# Altium schematic sheet a0206-2006.14.SchDoc
size 558 x 431 mm
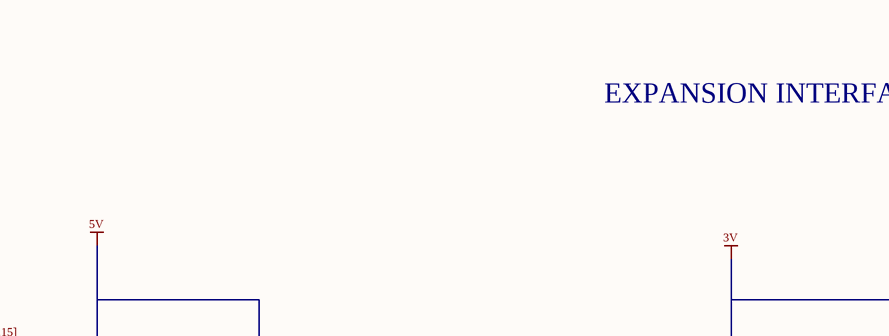
[diagram p0: a0206-2006.14.SchDoc, top left]
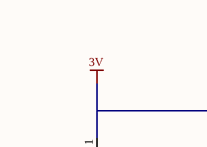
[diagram p1: a0206-2006.14.SchDoc, top right]
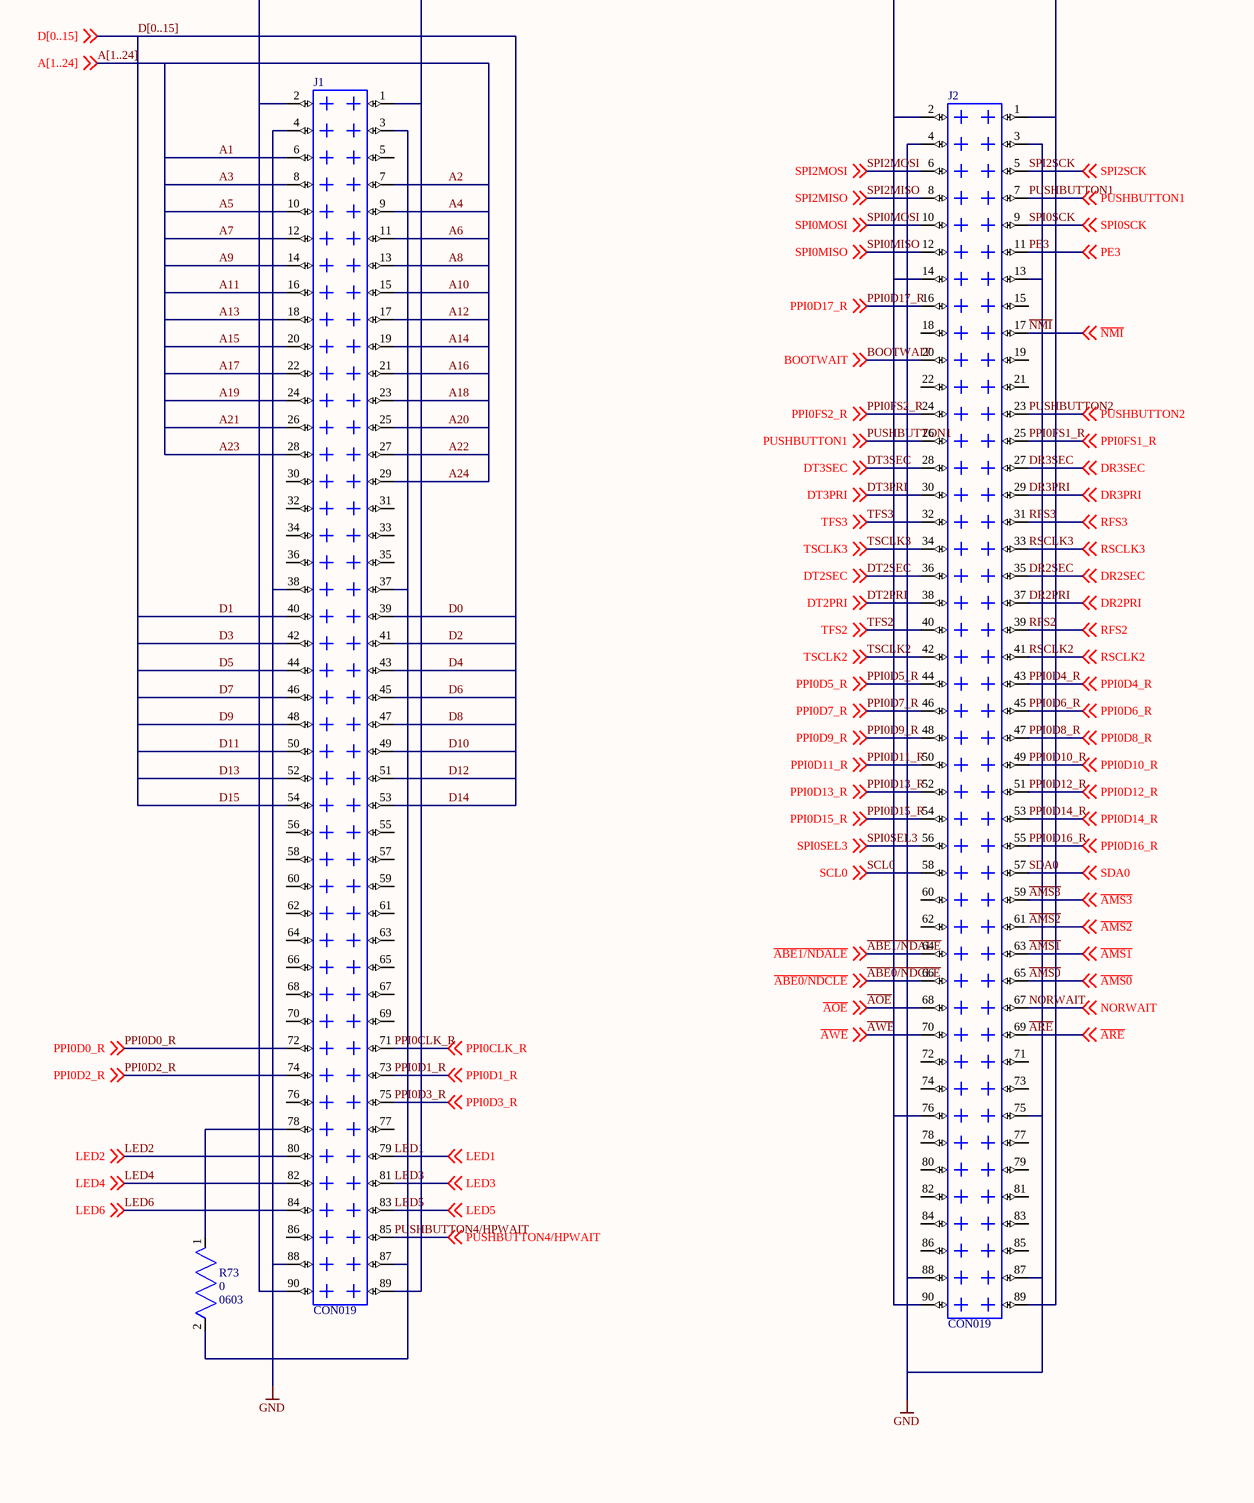
[diagram p2: a0206-2006.14.SchDoc, bottom left]
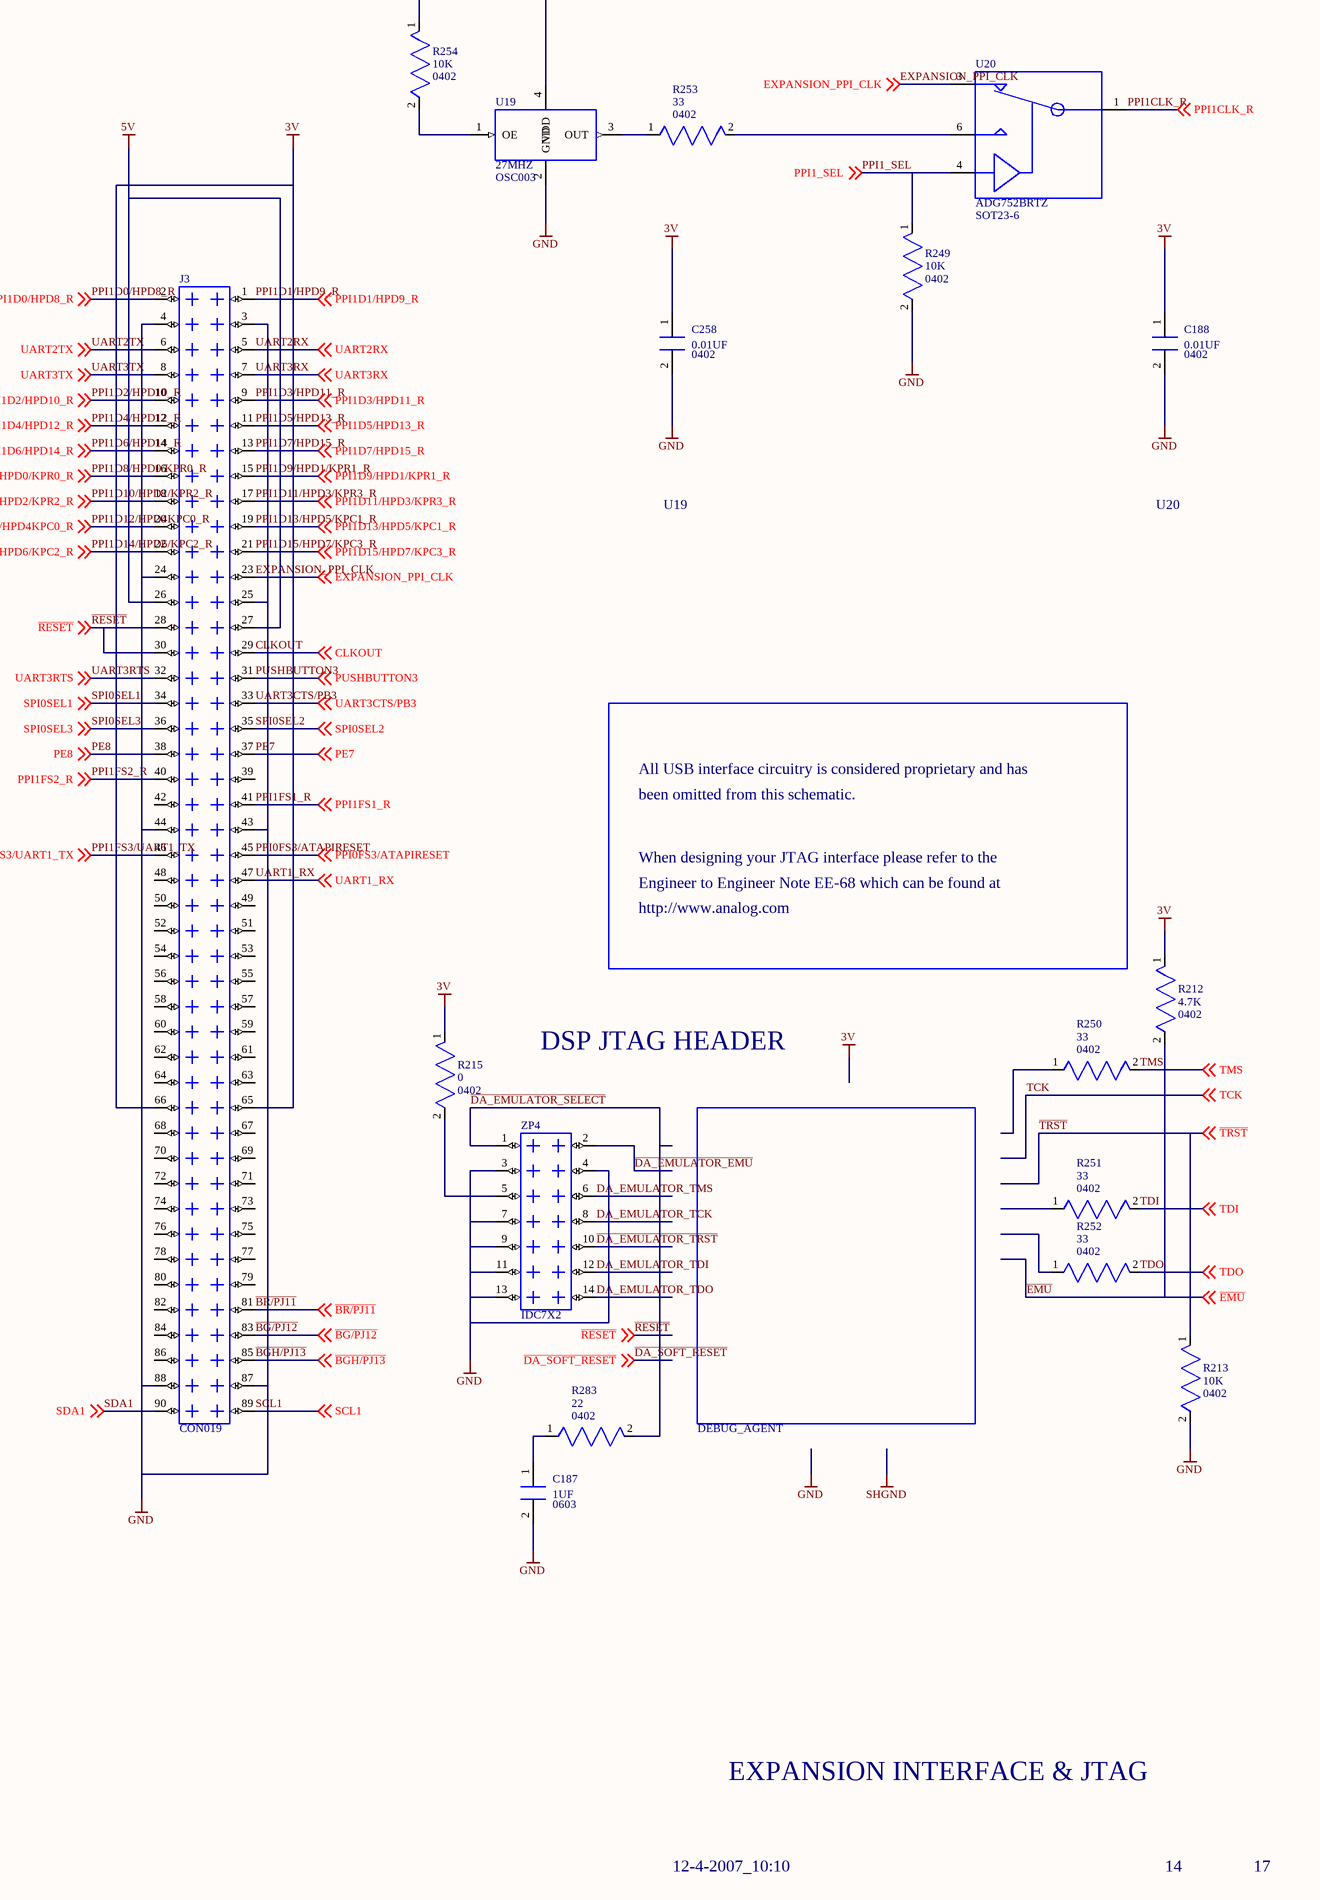
[diagram p3: a0206-2006.14.SchDoc, bottom right]

## Parts
*  DEBUG_AGENT  [DEBUG_AGENT]
C187  value 1UF  [0603]  (hidden comment: *)
C188  value 0.01UF  [0402]  (hidden comment: *)
C258  value 0.01UF  [0402]  (hidden comment: *)
J1  *  [CON019]  (value not drawn)
J2  *  [CON019]  (value not drawn)
J3  *  [CON019]  (value not drawn)
R73  value 0  [0603]  (hidden comment: *)
R212  value 4.7K  [0402]  (hidden comment: *)
R213  value 10K  [0402]  (hidden comment: *)
R215  value 0  [0402]  (hidden comment: *)
R249  value 10K  [0402]  (hidden comment: *)
R250  value 33  [0402]  (hidden comment: *)
R251  value 33  [0402]  (hidden comment: *)
R252  value 33  [0402]  (hidden comment: *)
R253  value 33  [0402]  (hidden comment: *)
R254  value 10K  [0402]  (hidden comment: *)
R283  value 22  [0402]  (hidden comment: *)
U19  value 27MHZ  [OSC003]  (hidden comment: *)
U20  PART: ADG752BRTZ  [SOT23-6]  (hidden comment: *)
ZP4  *  [IDC7X2]  (value not drawn)

## Nets
3V: C188.1(A) C258.1(A) J2.1 J2.2 J2.14 J2.76 J2.89 J2.90 J3.65 J3.66 R212.1(N1) R215.1(N1) R254.1(N1) U19.4(VDD) U20.2(3V)
5V: J1.1 J1.2 J1.89 J1.90 J3.26 J3.27
GND: C187.2(B) C188.2(B) C258.2(B) J1.3 J1.4 J1.37 J1.38 J1.87 J1.88 J2.3 J2.4 J2.13 J2.75 J2.87 J2.88 J3.3 J3.4 J3.24 J3.25 J3.43 J3.44 J3.87 J3.88 R73.2(N2) R213.2(N2) R249.2(N2) U19.2(GND) U20.5(GND) ZP4.3 ZP4.4 ZP4.7 ZP4.9 ZP4.11 ZP4.13
A1: J1.6
A2: J1.7
A3: J1.8
A4: J1.9
A5: J1.10
A6: J1.11
A7: J1.12
A8: J1.13
A9: J1.14
A10: J1.15
A11: J1.16
A12: J1.17
A13: J1.18
A14: J1.19
A15: J1.20
A16: J1.21
A17: J1.22
A18: J1.23
A19: J1.24
A20: J1.25
A21: J1.26
A22: J1.27
A23: J1.28
A24: J1.29
~{ABE0/NDCLE}: J2.66 ; off-sheet ~{ABE0/NDCLE}
~{ABE1/NDALE}: J2.64 ; off-sheet ~{ABE1/NDALE}
~{AMS0}: J2.65 ; off-sheet ~{AMS0}
~{AMS1}: J2.63 ; off-sheet ~{AMS1}
~{AMS2}: J2.61 ; off-sheet ~{AMS2}
~{AMS3}: J2.59 ; off-sheet ~{AMS3}
~{AOE}: J2.68 ; off-sheet ~{AOE}
~{ARE}: J2.69 ; off-sheet ~{ARE}
~{AWE}: J2.70 ; off-sheet ~{AWE}
~{BG/PJ12}: J3.83 ; off-sheet ~{BG/PJ12}
~{BGH/PJ13}: J3.85 ; off-sheet ~{BGH/PJ13}
~{BR/PJ11}: J3.81 ; off-sheet ~{BR/PJ11}
BOOTWAIT: J2.20 ; off-sheet BOOTWAIT
CLKOUT: J3.29 ; off-sheet CLKOUT
D0: J1.39
D1: J1.40
D2: J1.41
D3: J1.42
D4: J1.43
D5: J1.44
D6: J1.45
D7: J1.46
D8: J1.47
D9: J1.48
D10: J1.49
D11: J1.50
D12: J1.51
D13: J1.52
D14: J1.53
D15: J1.54
~{DA_EMULATOR_EMU}: ZP4.2
~{DA_EMULATOR_SELECT}: R283.2(N2) ZP4.1
~{DA_EMULATOR_TRST}: ZP4.10
DA_EMULATOR_TCK: ZP4.8
DA_EMULATOR_TDI: ZP4.12
DA_EMULATOR_TDO: ZP4.14
DA_EMULATOR_TMS: ZP4.6
DR2PRI: J2.37 ; off-sheet DR2PRI
DR2SEC: J2.35 ; off-sheet DR2SEC
DR3PRI: J2.29 ; off-sheet DR3PRI
DR3SEC: J2.27 ; off-sheet DR3SEC
DT2PRI: J2.38 ; off-sheet DT2PRI
DT2SEC: J2.36 ; off-sheet DT2SEC
DT3PRI: J2.30 ; off-sheet DT3PRI
DT3SEC: J2.28 ; off-sheet DT3SEC
~{EMU}: R212.2(N2) ; off-sheet ~{EMU}
EXPANSION_PPI_CLK: J3.23 U20.3(S1) ; off-sheet EXPANSION_PPI_CLK
LED1: J1.79 ; off-sheet LED1
LED2: J1.80 ; off-sheet LED2
LED3: J1.81 ; off-sheet LED3
LED4: J1.82 ; off-sheet LED4
LED5: J1.83 ; off-sheet LED5
LED6: J1.84 ; off-sheet LED6
~{NMI}: J2.17 ; off-sheet ~{NMI}
NORWAIT: J2.67 ; off-sheet NORWAIT
PE3: J2.11 ; off-sheet PE3
PE7: J3.37 ; off-sheet PE7
PE8: J3.38 ; off-sheet PE8
PPI0CLK_R: J1.71 ; off-sheet PPI0CLK_R
PPI0D0_R: J1.72 ; off-sheet PPI0D0_R
PPI0D1_R: J1.73 ; off-sheet PPI0D1_R
PPI0D2_R: J1.74 ; off-sheet PPI0D2_R
PPI0D3_R: J1.75 ; off-sheet PPI0D3_R
PPI0D4_R: J2.43 ; off-sheet PPI0D4_R
PPI0D5_R: J2.44 ; off-sheet PPI0D5_R
PPI0D6_R: J2.45 ; off-sheet PPI0D6_R
PPI0D7_R: J2.46 ; off-sheet PPI0D7_R
PPI0D8_R: J2.47 ; off-sheet PPI0D8_R
PPI0D9_R: J2.48 ; off-sheet PPI0D9_R
PPI0D10_R: J2.49 ; off-sheet PPI0D10_R
PPI0D11_R: J2.50 ; off-sheet PPI0D11_R
PPI0D12_R: J2.51 ; off-sheet PPI0D12_R
PPI0D13_R: J2.52 ; off-sheet PPI0D13_R
PPI0D14_R: J2.53 ; off-sheet PPI0D14_R
PPI0D15_R: J2.54 ; off-sheet PPI0D15_R
PPI0D16_R: J2.55 ; off-sheet PPI0D16_R
PPI0D17_R: J2.16 ; off-sheet PPI0D17_R
PPI0FS1_R: J2.25 ; off-sheet PPI0FS1_R
PPI0FS2_R: J2.24 ; off-sheet PPI0FS2_R
PPI0FS3/ATAPIRESET: J3.45 ; off-sheet PPI0FS3/ATAPIRESET
PPI1_SEL: R249.1(N1) U20.4(IN) ; off-sheet PPI1_SEL
PPI1CLK_R: U20.1(D) ; off-sheet PPI1CLK_R
PPI1D0/HPD8_R: J3.2 ; off-sheet PPI1D0/HPD8_R
PPI1D1/HPD9_R: J3.1 ; off-sheet PPI1D1/HPD9_R
PPI1D2/HPD10_R: J3.10 ; off-sheet PPI1D2/HPD10_R
PPI1D3/HPD11_R: J3.9 ; off-sheet PPI1D3/HPD11_R
PPI1D4/HPD12_R: J3.12 ; off-sheet PPI1D4/HPD12_R
PPI1D5/HPD13_R: J3.11 ; off-sheet PPI1D5/HPD13_R
PPI1D6/HPD14_R: J3.14 ; off-sheet PPI1D6/HPD14_R
PPI1D7/HPD15_R: J3.13 ; off-sheet PPI1D7/HPD15_R
PPI1D8/HPD0/KPR0_R: J3.16 ; off-sheet PPI1D8/HPD0/KPR0_R
PPI1D9/HPD1/KPR1_R: J3.15 ; off-sheet PPI1D9/HPD1/KPR1_R
PPI1D10/HPD2/KPR2_R: J3.18 ; off-sheet PPI1D10/HPD2/KPR2_R
PPI1D11/HPD3/KPR3_R: J3.17 ; off-sheet PPI1D11/HPD3/KPR3_R
PPI1D12/HPD4KPC0_R: J3.20 ; off-sheet PPI1D12/HPD4KPC0_R
PPI1D13/HPD5/KPC1_R: J3.19 ; off-sheet PPI1D13/HPD5/KPC1_R
PPI1D14/HPD6/KPC2_R: J3.22 ; off-sheet PPI1D14/HPD6/KPC2_R
PPI1D15/HPD7/KPC3_R: J3.21 ; off-sheet PPI1D15/HPD7/KPC3_R
PPI1FS1_R: J3.41 ; off-sheet PPI1FS1_R
PPI1FS2_R: J3.40 ; off-sheet PPI1FS2_R
PPI1FS3/UART1_TX: J3.46 ; off-sheet PPI1FS3/UART1_TX
PUSHBUTTON1: J2.7 J2.26 ; off-sheet PUSHBUTTON1
PUSHBUTTON2: J2.23 ; off-sheet PUSHBUTTON2
PUSHBUTTON3: J3.31 ; off-sheet PUSHBUTTON3
PUSHBUTTON4/HPWAIT: J1.85 ; off-sheet PUSHBUTTON4/HPWAIT
~{RESET}: J3.28 J3.30 ; off-sheet ~{RESET}
RFS2: J2.39 ; off-sheet RFS2
RFS3: J2.31 ; off-sheet RFS3
RSCLK2: J2.41 ; off-sheet RSCLK2
RSCLK3: J2.33 ; off-sheet RSCLK3
SCL0: J2.58 ; off-sheet SCL0
SCL1: J3.89 ; off-sheet SCL1
SDA0: J2.57 ; off-sheet SDA0
SDA1: J3.90 ; off-sheet SDA1
SPI0MISO: J2.12 ; off-sheet SPI0MISO
SPI0MOSI: J2.10 ; off-sheet SPI0MOSI
SPI0SCK: J2.9 ; off-sheet SPI0SCK
SPI0SEL1: J3.34 ; off-sheet SPI0SEL1
SPI0SEL2: J3.35 ; off-sheet SPI0SEL2
SPI0SEL3: J2.56 J3.36 ; off-sheet SPI0SEL3
SPI2MISO: J2.8 ; off-sheet SPI2MISO
SPI2MOSI: J2.6 ; off-sheet SPI2MOSI
SPI2SCK: J2.5 ; off-sheet SPI2SCK
~{TRST}: R213.1(N1) ; off-sheet ~{TRST}
TDI: R251.2(N2) ; off-sheet TDI
TDO: R252.2(N2) ; off-sheet TDO
TFS2: J2.40 ; off-sheet TFS2
TFS3: J2.32 ; off-sheet TFS3
TMS: R250.2(N2) ; off-sheet TMS
TSCLK2: J2.42 ; off-sheet TSCLK2
TSCLK3: J2.34 ; off-sheet TSCLK3
UART1_RX: J3.47 ; off-sheet UART1_RX
UART2RX: J3.5 ; off-sheet UART2RX
UART2TX: J3.6 ; off-sheet UART2TX
UART3CTS/PB3: J3.33 ; off-sheet UART3CTS/PB3
UART3RTS: J3.32 ; off-sheet UART3RTS
UART3RX: J3.7 ; off-sheet UART3RX
UART3TX: J3.8 ; off-sheet UART3TX
NetC187_1: C187.1(A) R283.1(N1)
NetJ1_78: J1.78 R73.1(N1)
NetR215_2: R215.2(N2) ZP4.5
NetR253_1: R253.1(N1) U19.3(OUT)
NetR253_2: R253.2(N2) U20.6(S2)
NetR254_2: R254.2(N2) U19.1(OE)

Not connected (* = marked no-connect by the designer): J1 5 30 31 32 33 34 35 36 55 56 57 58 59 60 61 62 63 64 65 66 67 68 69 70 76 77 86; J2 15 18 19 21 22 60 62 71 72 73 74 77 78 79 80 81 82 83 84 85 86; J3 39 42 48 49 50 51 52 53 54 55 56 57 58 59 60 61 62 63 64 67 68 69 70 71 72 73 74 75 76 77 78 79 80 82 84 86; R250 1(N1); R251 1(N1); R252 1(N1)

## Buses and harness runs
bus A[1..24]
bus D[0..15]

## Notes on the sheet
- EXPANSION INTERFACE (TYPE B)
- U19
- U20
- All USB interface circuitry is considered proprietary and has
- been omitted from this schematic.
- When designing your JTAG interface please refer to the
- Engineer to Engineer Note EE-68 which can be found at
- http://www.analog.com
- DSP JTAG HEADER
- EXPANSION INTERFACE & JTAG
- 12-4-2007_10:10
- 14
- 17
- A
- B
- C
- D
- 1
- 2
- 3
- 20 Cotton Road
- 4
- DEVICES
- ANALOG
- Nashua, NH 03063
- PH: 1-800-ANALOGD
- Title
- ADSP-BF548 EZ-KIT LITE
- Size
- Board No.
- A0206-2006
- Rev
- 1.4B
- Date
- Sheet
- of

## Library data of the parts
* = DEBUG_AGENT.1: CLASS: DA; PART: DEBUG_AGENT; PKG_TYPE: DEBUG_AGENT; LEVEL: DA; DEVICE: DEBUG_AGENT
C187 = CAP_NON_POLARIZED.2: PART_SPEC: CAPACITOR; LEVEL: STD; TOLERANCE: 10%; VOLTAGE: 16V; PRT_NUM: 7000344; BOARDS: BOTH; TYPE: X5R; PKG_TYPE: 0603; ROHS: ROHS
C188 = CAP_NON_POLARIZED.2: PART_SPEC: CAPACITOR; LEVEL: STD; TOLERANCE: 10%; VOLTAGE: 16V; PRT_NUM: 7000279; BOARDS: BOTH; TYPE: X7R; PKG_TYPE: 0402; ROHS: ROHS
C258 = CAP_NON_POLARIZED.2: PART_SPEC: CAPACITOR; LEVEL: STD; TYPE: X7R; BOARDS: BOTH; PRT_NUM: 7000279; VOLTAGE: 16V; TOLERANCE: 10%; PKG_TYPE: 0402; ROHS: ROHS
J1-J3 = CON_45X2_F.1: SOCKET SMT; PART_SPEC: CONNECTOR; LEVEL: STD; PRT_NUM: 6000125; BOARDS: KIT; CONFIGURATION: 45X2; PKG_TYPE: CON019; TYPE: .05; ROHS: ROHS
R73 = RES_STANDARD.2: PART_SPEC: RESISTOR; LEVEL: STD; POWER: 1/10W; TOLERANCE: 5%; PRT_NUM: 7000371; BOARDS: BOTH; PKG_TYPE: 0603; ROHS: ROHS
R212 = RES_STANDARD.2: PART_SPEC: RESISTOR; LEVEL: STD; PRT_NUM: 7000281; TOLERANCE: 5%; BOARDS: BOTH; POWER: 1/16W; PKG_TYPE: 0402; ROHS: ROHS
R213 R249 = RES_STANDARD.2: PART_SPEC: RESISTOR; LEVEL: STD; POWER: 1/16W; BOARDS: BOTH; TOLERANCE: 5%; PRT_NUM: 7000280; PKG_TYPE: 0402; ROHS: ROHS
R215 = RES_STANDARD.2: PART_SPEC: RESISTOR; LEVEL: STD; POWER: 1/16W; BOARDS: BOTH; TOLERANCE: 5%; PRT_NUM: 7000282; PKG_TYPE: 0402; ROHS: ROHS
R250 R252 = RES_STANDARD.1: PART_SPEC: RESISTOR; LEVEL: STD; PRT_NUM: 7000285; POWER: 1/16W; TOLERANCE: 5%; PKG_TYPE: 0402; ROHS: ROHS
R251 = RES_STANDARD.1: PART_SPEC: RESISTOR; LEVEL: STD; TOLERANCE: 5%; POWER: 1/16W; PRT_NUM: 7000285; PKG_TYPE: 0402; ROHS: ROHS
R253 = RES_STANDARD.1: PART_SPEC: RESISTOR; LEVEL: STD; PRT_NUM: 7000285; TOLERANCE: 5%; BOARDS: BOTH; POWER: 1/16W; PKG_TYPE: 0402; ROHS: ROHS
R254 = RES_STANDARD.2: PART_SPEC: RESISTOR; LEVEL: STD; PRT_NUM: 7000280; TOLERANCE: 5%; BOARDS: BOTH; POWER: 1/16W; PKG_TYPE: 0402; ROHS: ROHS
R283 = RES_STANDARD.1: PART_SPEC: RESISTOR; LEVEL: STD; TOLERANCE: 5%; POWER: 1/16W; PRT_NUM: 7000284; PKG_TYPE: 0402; ROHS: ROHS
U19 = OSC_SMT_OE_POWER.1: OSCILLATOR; LEVEL: STD; PRT_NUM: 1000407; BOARDS: BOTH; PART_SPEC: OSCILLATOR; PKG_TYPE: OSC003; ROHS: ROHS
U20 = ICS_AD752.1: CMOS SPDT SWITCH; LEVEL: STD; PRT_NUM: 30-025203-01; PKG_TYPE: SOT23-6; WEB: http://www.analog.com/en/prod/0%2C2877%2CADG752%2C00.html; ROHS: ROHS
ZP4 = CON_7X2.1: HEADER; PART_SPEC: CONNECTOR; LEVEL: STD; CLASS: DA; PRT_NUM: 6000777; BOARDS: BOTH; CONFIGURATION: 7X2; PKG_TYPE: IDC7X2; TYPE: IDC; ROHS: ROHS